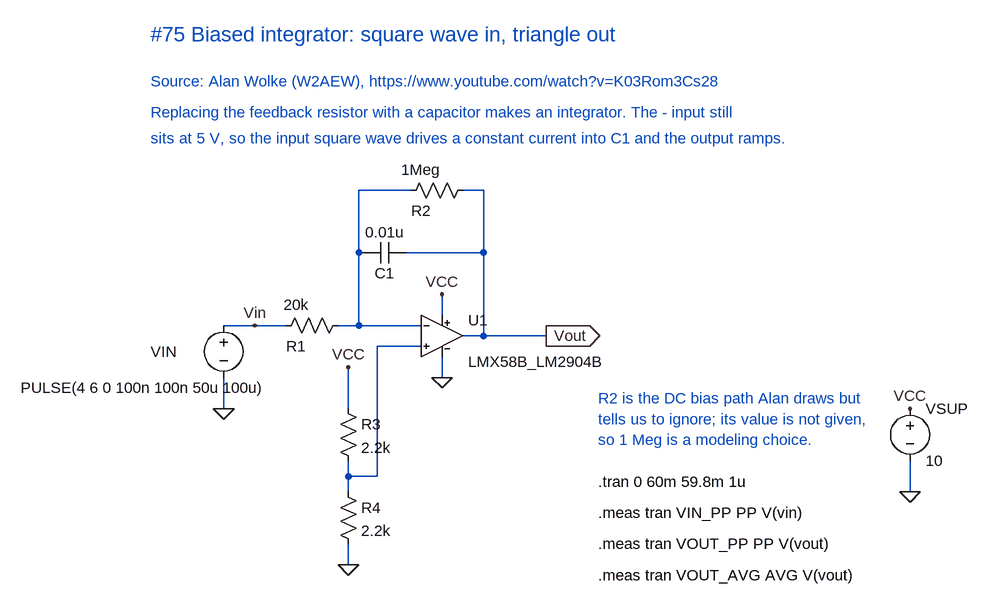
[diagram p0: schematic Biased integrator.asc]
Biased integrator.asc, the LTspice schematic file:
Version 4.1
SHEET 1 1200 900
WIRE 160 48 64 48
WIRE 272 48 240 48
WIRE 368 48 272 48
WIRE 64 176 64 128
WIRE 272 -64 272 48
WIRE 280 -64 272 -64
WIRE 464 -64 344 -64
WIRE 272 -160 272 -64
WIRE 352 -160 272 -160
WIRE 464 -160 432 -160
WIRE 464 -64 464 -160
WIRE 464 64 464 -64
WIRE 464 64 432 64
WIRE 560 64 464 64
WIRE 400 32 400 0
WIRE 400 128 400 96
WIRE 256 112 256 176
WIRE 256 304 256 256
WIRE 256 416 256 384
WIRE 300 280 256 280
WIRE 300 80 300 280
WIRE 368 80 300 80
WIRE 1120 256 1120 304
FLAG 64 176 0
FLAG 400 128 0
FLAG 256 416 0
FLAG 1120 304 0
FLAG 400 0 VCC
FLAG 256 112 VCC
FLAG 1120 176 VCC
FLAG 560 64 Vout
IOPIN 560 64 Out
FLAG 112 48 Vin
SYMBOL voltage 64 32 R0
WINDOW 123 0 0 Left 0
WINDOW 39 0 0 Left 0
WINDOW 0 -72 56 Right 2
WINDOW 3 -312 112 Left 2
SYMATTR InstName VIN
SYMATTR Value PULSE(4 6 0 100n 100n 50u 100u)
SYMBOL res 144 64 R270
WINDOW 0 0 32 VBottom 2
WINDOW 3 32 32 VTop 2
SYMATTR InstName R1
SYMATTR Value 20k
SYMBOL cap 280 -48 R270
WINDOW 0 0 32 VBottom 2
WINDOW 3 32 32 VTop 2
SYMATTR InstName C1
SYMATTR Value 0.01u
SYMBOL res 336 -144 R270
WINDOW 0 0 32 VBottom 2
WINDOW 3 32 32 VTop 2
SYMATTR InstName R2
SYMATTR Value 1Meg
SYMBOL res 240 160 R0
SYMATTR InstName R3
SYMATTR Value 2.2k
SYMBOL res 240 288 R0
SYMATTR InstName R4
SYMATTR Value 2.2k
SYMBOL voltage 1120 160 R0
WINDOW 123 0 0 Left 0
WINDOW 39 0 0 Left 0
SYMATTR InstName VSUP
SYMATTR Value 10
SYMBOL ..\..\LTspice\Symbols\LMX58B_LM2904B 400 0 R0
WINDOW 0 40 40 Left 2
WINDOW 3 40 104 Left 2
SYMATTR InstName U1
SYMATTR Value LMX58B_LM2904B
TEXT -48 -400 Left 3 ;#75 Biased integrator: square wave in, triangle out
TEXT -48 -328 Left 2 ;Source: Alan Wolke (W2AEW), https://www.youtube.com/watch?v=K03Rom3Cs28
TEXT -48 -280 Left 2 ;Replacing the feedback resistor with a capacitor makes an integrator. The - input still
TEXT -48 -240 Left 2 ;sits at 5 V, so the input square wave drives a constant current into C1 and the output ramps.
TEXT 640 160 Left 2 ;R2 is the DC bias path Alan draws but
TEXT 640 192 Left 2 ;tells us to ignore; its value is not given,
TEXT 640 224 Left 2 ;so 1 Meg is a modeling choice.
TEXT 640 288 Left 2 !.tran 0 60m 59.8m 1u
TEXT 640 336 Left 2 !.meas tran VIN_PP PP V(vin)
TEXT 640 384 Left 2 !.meas tran VOUT_PP PP V(vout)
TEXT 640 432 Left 2 !.meas tran VOUT_AVG AVG V(vout)

The netlist it stands for:
* Biased integrator.asc
VIN Vin 0 PULSE(4 6 0 100n 100n 50u 100u)
R1 Vin N001 20k
C1 N001 Vout 0.01u
R2 N001 Vout 1Meg
R3 VCC N002 2.2k
R4 N002 0 2.2k
VSUP VCC 0 10
X§U1 N002 N001 VCC 0 Vout LMX58B_LM2904B  ; pins In+ In- V+ V- OUT
* #75 Biased integrator: square wave in, triangle out
* Source: Alan Wolke (W2AEW), https://www.youtube.com/watch?v=K03Rom3Cs28
* Replacing the feedback resistor with a capacitor makes an integrator. The - input still
* sits at 5 V, so the input square wave drives a constant current into C1 and the output ramps.
* R2 is the DC bias path Alan draws but
* tells us to ignore; its value is not given,
* so 1 Meg is a modeling choice.
.tran 0 60m 59.8m 1u
.meas tran VIN_PP PP V(vin)
.meas tran VOUT_PP PP V(vout)
.meas tran VOUT_AVG AVG V(vout)
.lib ..\..\LTspice\Models\Texas-Instruments\lmx58b_lm2904b.lib
.backanno
.end